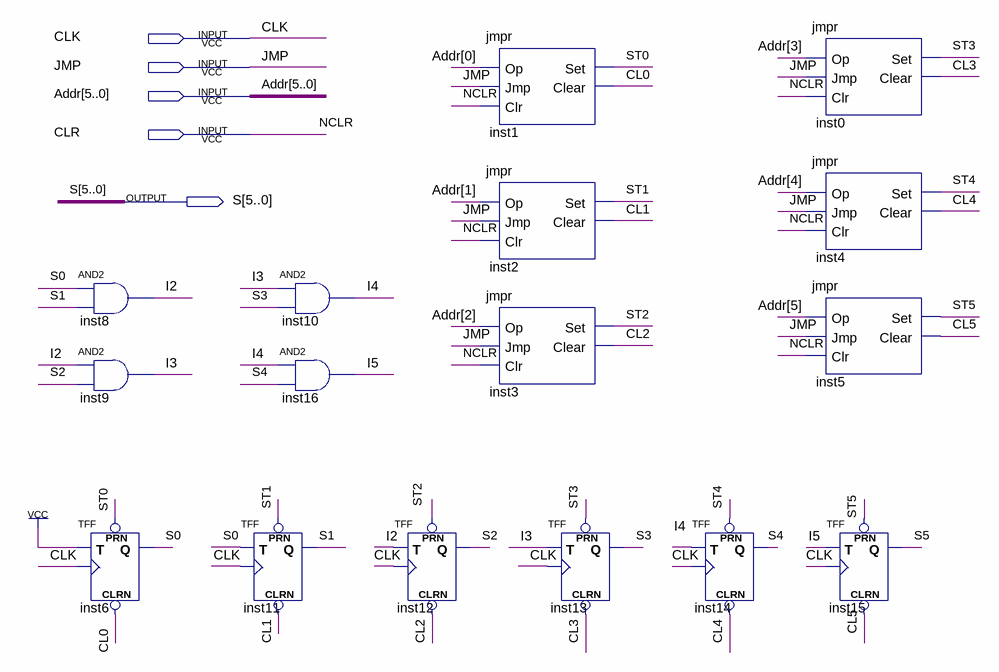
[diagram p0: schematic sheet]
// Quartus schematic counter.bdf as structural Verilog: 16 symbols, 5 pins
module counter (
  input  CLK,
  input  JMP,
  input  [5:0] Addr,
  input  CLR,
  output [5:0] S
);

  wire CL0, CL1, CL2, CL3, CL4, CL5, I2, I3, I4, I5, ST0, ST1, ST2, ST3, ST4, ST5;

  and inst8 (I2, S[0], S[1]);
  and inst9 (I3, I2, S[2]);
  TFF inst6 (.PRN(ST0), .CLRN(CL0), .T(1'b1), .CLK(CLK), .Q(S[0]));
  and inst10 (I4, I3, S[3]);
  and inst16 (I5, I4, S[4]);
  TFF inst11 (.PRN(ST1), .CLRN(CL1), .T(S[0]), .CLK(CLK), .Q(S[1]));
  TFF inst12 (.PRN(ST2), .CLRN(CL2), .T(I2), .CLK(CLK), .Q(S[2]));
  jmpr inst1 (.Op(Addr[0]), .Jmp(JMP), .Clr(CLR), .Set(ST0), .Clear(CL0));
  jmpr inst2 (.Op(Addr[1]), .Jmp(JMP), .Clr(CLR), .Set(ST1), .Clear(CL1));
  jmpr inst3 (.Op(Addr[2]), .Jmp(JMP), .Clr(CLR), .Set(ST2), .Clear(CL2));
  TFF inst13 (.PRN(ST3), .CLRN(CL3), .T(I3), .CLK(CLK), .Q(S[3]));
  TFF inst14 (.PRN(ST4), .CLRN(CL4), .T(I4), .CLK(CLK), .Q(S[4]));
  jmpr inst0 (.Op(Addr[3]), .Jmp(JMP), .Clr(CLR), .Set(ST3), .Clear(CL3));
  jmpr inst4 (.Op(Addr[4]), .Jmp(JMP), .Clr(CLR), .Set(ST4), .Clear(CL4));
  jmpr inst5 (.Op(Addr[5]), .Jmp(JMP), .Clr(CLR), .Set(ST5), .Clear(CL5));
  TFF inst15 (.PRN(ST5), .CLRN(CL5), .T(I5), .CLK(CLK), .Q(S[5]));

  // Other names for the same wires on the sheet: NCLR = CLR
endmodule
